# Altium project fin-microphone.PrjPcb
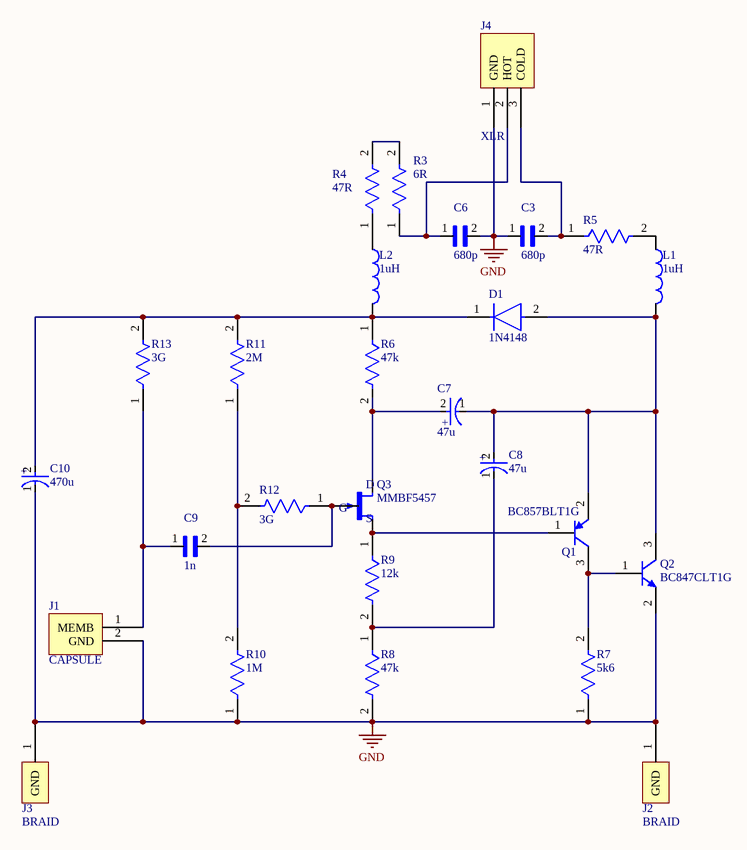
[diagram p0: fin-microphone.SchDoc]
1 sheet, 27 parts. Net scope: global (net labels, ports and power ports of the same name join across sheets).
Board file: fin-microphone.PcbDoc

## Sheet fin-microphone.SchDoc: FIN Condenser Microphone — Altium rev. 2
size A; DrawnBy: kzbj; DocumentNumber: FIN-MIC-01; Revision: 2; SheetNumber: 1; SheetTotal: 1

### Parts
C3  680p  [*CAPRB500W50L400T250H550]
C6  680p  [*CAPRB500W50L400T250H550]
C7  47u  [FP-RAD-TH-D_6_3_0_5-L_11-MFG]
C8  47u  [FP-RAD-TH-D_6_3_0_5-L_11-MFG]
C9  1n  [*CAPRB500W50L400T250H550]
C10  470u  [FP-RAD-TH-D_10_0_5-L_20_2-MFG]
D1  1N4148  [FP-017AG-MFG]
J1  CAPSULE  [WIRE_CAPSULE_1x02]
J2  BRAID  [WIRE_GND_1x01]
J3  BRAID  [WIRE_GND_1x01]
J4  XLR  [WIRE_XLR_1x03]
L1  1uH  [INDC3225X170N]
L2  1uH  [INDC3225X170N]
Q1  BC857BLT1G  [ONSC-SOT-23-3-318-08_V]
Q2  BC847CLT1G  [ONSC-SOT-23-3-318-08_V]
Q3  MMBF5457  [SOT23]
R3  6R  [FP-MRS25-MFG]
R4  47R  [FP-MRS25-MFG]
R5  47R  [FP-MRS25-MFG]
R6  47k  [FP-MRS25-MFG]
R7  5k6  [FP-MRS25-MFG]
R8  47k  [FP-MRS25-MFG]
R9  12k  [FP-MRS25-MFG]
R10  1M  [FP-MRS25-MFG]
R11  2M  [FP-MRS25-MFG]
R12  3G  [SM102_RADIAL]
R13  3G  [SM102_RADIAL]

### Nets
GND: C3.1 C6.2 C10.1(C) J1.2(GND) J2.1(GND) J3.1(GND) J4.1(GND) Q2.2(E) R7.1 R8.2 R10.1
NetC3_2: C3.2 J4.3(COLD) R5.1
NetC6_1: C6.1 J4.2(HOT) R3.1
NetC7_1: C7.1(C) C8.2(A) D1.2(A) L1.2 Q1.2(E) Q2.3(C)
NetC7_2: C7.2(A) Q3.1(D) R6.2
NetC8_1: C8.1(C) R8.1 R9.2
NetC9_1: C9.1 J1.1(MEMB) R13.1
NetC9_2: C9.2 Q3.3(G) R12.1
NetC10_2: C10.2(A) D1.1(C) L2.2 R6.1 R11.2 R13.2
NetL1_1: L1.1 R5.2
NetL2_1: L2.1 R4.1
NetQ1_1: Q1.1(B) Q3.2(S) R9.1
NetQ1_3: Q1.3(C) Q2.1(B) R7.2
NetR3_2: R3.2 R4.2
NetR10_2: R10.2 R11.1 R12.2

### Notes on the sheet
- (in symbol CMP-05427-001321-1) +
- (in symbol CMP-05427-002121-1) +

### Library data of the parts
C3 C6 C9 = FG28C0G2A681JNT00: MANUFACTURER: TDK; MAXIMUM_PACKAGE_HEIGHT: 0.0 mm; PARTREV: 20200310; SOURCE_URL: https://www.snapeda.com/parts/FG28C0G2A681JNT00/TDK/view-part/?ref=snap; STANDARD: IPC-7351B; Value: *
C7 C8 = CMP-05427-001321-1: Aluminum Electrolytic Capacitors (Radial Lead Type) 47uF ±20% 50V; Lead Diameter: 0.5mm; Ripple Current (AC): 405mA; Impedance: 140mR; Life (Hours): 5000Hour; Construction: RADIAL; REACH SVHC: Yes; Voltage: 50V; Packaging: Bulk; Series: FR Radial; Voltage Rating: 50V; Capacitance: 47uF; Termination: Radial; Diameter: 6.3mm; Ripple Current: 405mA; Max Operating Temperature: 105°C; Height: 11.2mm; Lead Pitch: 2.5mm; Tolerance: 20%; Min Operating Temperature: -40°C; RoHS Compliant: Yes; Case/Package: Radial
C10 = CMP-05427-002121-1: Aluminum Electrolytic Capacitors (Radial Lead Type) AEC-Q200 Qualified 470uF ±20% 50V
D1 = CMP-07163-000046-1: DIODE GEN PURP 100V 200MA DO35; Forward Voltage: 1V; Max Power Dissipation: 500mW; Max Reverse Current: 5uA; Forward Current: 300mA; Current: 4A; Reverse Recovery Time: 4ns; Element Configuration: Single; Outside Diameter: 1.85mm; Capacitance: 4pF; Polarity: Standard; Max Forward Surge Current (Ifsm): 1A; Reverse Voltage: 100V; Output Current: 200mA; Average Rectified Current: 200mA; Diameter: 1.91mm; Max Repetitive Reverse Voltage (Vrrm): 100V; Current Rating: 200mA; Case/Package: DO-35; Lead Free: Lead Free; Number of Pins: 2; Recovery Time: 4ns; Packaging: Bulk; Contact Plating: Tin; Voltage: 100V; Mount: Through Hole; Max Surge Current: 4A; Package Quantity: 2000; Width: 1.91mm; Max Reverse Voltage (DC): 100V; Length: 4.56mm; Radiation Hardening: No; Power Dissipation: 500mW; Voltage Rating (DC): 100V; Peak Non-Repetitive Surge Current: 4A; REACH SVHC: No SVHC; Height: 4.56mm; Max Operating Temperature: 175°C; Series: -; Weight: 0.01lb; Min Operating Temperature: -65°C
J1 = CONN_CAPSULE: Capsule wire pads (1 = membrane, 2 = backplate/GND).
J2 J3 = CONN_GND: Ground braid solder pad
J4 = CONN_XLR: XLR wire pads (1 = GND, 2 = HOT, 3 = COLD).
L1 L2 = BRL3225T1R0M: 1 ÂµH Semi-Shielded Drum Core, Wirewound Inductor 2.2 A 51.6mOhm Max 1210 (3225 Metric); MF: Taiyo Yuden; SnapEDA_Link: https://www.snapeda.com/parts/BRL3225T1R0M/Taiyo+Yuden/view-part/?ref=snap; Package: 3225 Taiyo Yuden; Value: *; MP: BRL3225T1R0M; Check_prices: https://www.snapeda.com/parts/BRL3225T1R0M/Taiyo+Yuden/view-part/?ref=eda
Q1 = CMP-1048-00798-1: General Purpose Transistor, PNP Silicon, 3-Pin SOT-23, Pb-Free, Tape and Reel; Manufacturer: On Semiconductor; IC Continuous (A): -0.1; fT Min (MHz): 100; Packing: Tape and Reel; ComponentLink1Description: Manufacturer URL; RoHS: TRUE; ComponentLink3Description: Package Specification; Polarity: PNP; ComponentLink3URL: http://www.onsemi.cn/pub_link/Collateral/318-08.PDF; DatasheetVersion: Rev. 13; PackageVersion: Rev. AP, 11/2009; PackageReference: SOT-23-3-318-08; PartNumber: BC857BLT1G; ComponentLink1URL: http://www.onsemi.com/; ComponentLink2URL: http://www.onsemi.cn/pub_link/Collateral/BC856ALT1-D.PDF; ComponentLink2Description: Datasheet; PackageDescription: 3-Pin Small Outline Transistor, Body 2.92 x 1.3 mm, Pitch 0.95 mm; Mounting Technology: Surface Mount
Q2 = CMP-1048-00770-1: General Purpose Transistor, NPN Silicon, 3-Pin SOT-23, Pb-Free, Tape and Reel; Manufacturer: On Semiconductor; IC Continuous (A): 0.1; fT Min (MHz): 100; ComponentLink1URL: http://www.onsemi.com/; ComponentLink3URL: http://www.onsemi.cn/pub_link/Collateral/318-08.PDF; PackageVersion: Rev. AP, 11/2009; RoHS: TRUE; Mounting Technology: Surface Mount; PackageDescription: 3-Pin Small Outline Transistor, Body 2.92 x 1.3 mm, Pitch 0.95 mm; Packing: Tape and Reel; DatasheetVersion: Rev. 11; ComponentLink1Description: Manufacturer URL; ComponentLink2Description: Datasheet; ComponentLink3Description: Package Specification; PackageReference: SOT-23-3-318-08; PartNumber: BC847CLT1G; ComponentLink2URL: http://www.onsemi.cn/pub_link/Collateral/BC846ALT1-D.PDF; Polarity: NPN
Q3 = MMBF5457*: JFET N-Channel 25 V 350 mW Surface Mount SOT-23-3; MF: ON Semiconductor; SnapEDA_Link: https://www.snapeda.com/parts/MMBF5457/Onsemi/view-part/?ref=snap; Package: SOT-23-3 ON Semiconductor; Value: *; MP: MMBF5457; Check_prices: https://www.snapeda.com/parts/MMBF5457/Onsemi/view-part/?ref=eda
R3-R11 = CMP-00030-42757237-1: MRS25000C1000FRP00 Resistor, 100 Ohm, ± 1%, 600 mW, Axial Leaded, Metal Film (Thin Film), Professional; Max Power Dissipation: 600mW; Resistance: 100Ω; Voltage Rating: 350V; Temperature Coefficient: 50ppm/°C; Lead Diameter: 600µm; RoHS: Compliant; Radiation Hardening: No; Schedule B: 8533210090, 8533210090; Length: 6.5mm; Packaging: Tape & Reel (TR); Number of Terminations: 2; Mount: Through Hole; Width: 2.5mm; Tolerance: 1%; Military Standard: Not; Voltage Rating (DC): 350V; Contact Plating: Tin; Number of Pins: 2; Max Operating Temperature: 155°C; NexarPartId: 42757237; Diameter: 2.5mm; Composition: Metal Film, Thin Film; REACH SVHC: Unknown; Power Rating: 600mW; Lead Free: Lead Free; Termination: Axial; Case/Package: Axial; Min Operating Temperature: -55°C
R12 R13 = CMP-00030-42757237-1_1: MRS25000C1000FRP00 Resistor, 100 Ohm, ± 1%, 600 mW, Axial Leaded, Metal Film (Thin Film), Professional; Max Power Dissipation: 600mW; Resistance: 100Ω; Voltage Rating: 350V; Temperature Coefficient: 50ppm/°C; Lead Diameter: 600µm; RoHS: Compliant; Radiation Hardening: No; Schedule B: 8533210090, 8533210090; Length: 6.5mm; Packaging: Tape & Reel (TR); Number of Terminations: 2; Mount: Through Hole; Width: 2.5mm; Tolerance: 1%; Military Standard: Not; Voltage Rating (DC): 350V; Contact Plating: Tin; Number of Pins: 2; Max Operating Temperature: 155°C; NexarPartId: 42757237; Diameter: 2.5mm; Composition: Metal Film, Thin Film; REACH SVHC: Unknown; Power Rating: 600mW; Lead Free: Lead Free; Termination: Axial; Case/Package: Axial; Min Operating Temperature: -55°C